# Altium schematic sheet Output_Stage.SchDoc
size 558 x 190 mm; SheetNumber: 2; SheetTotal: 3
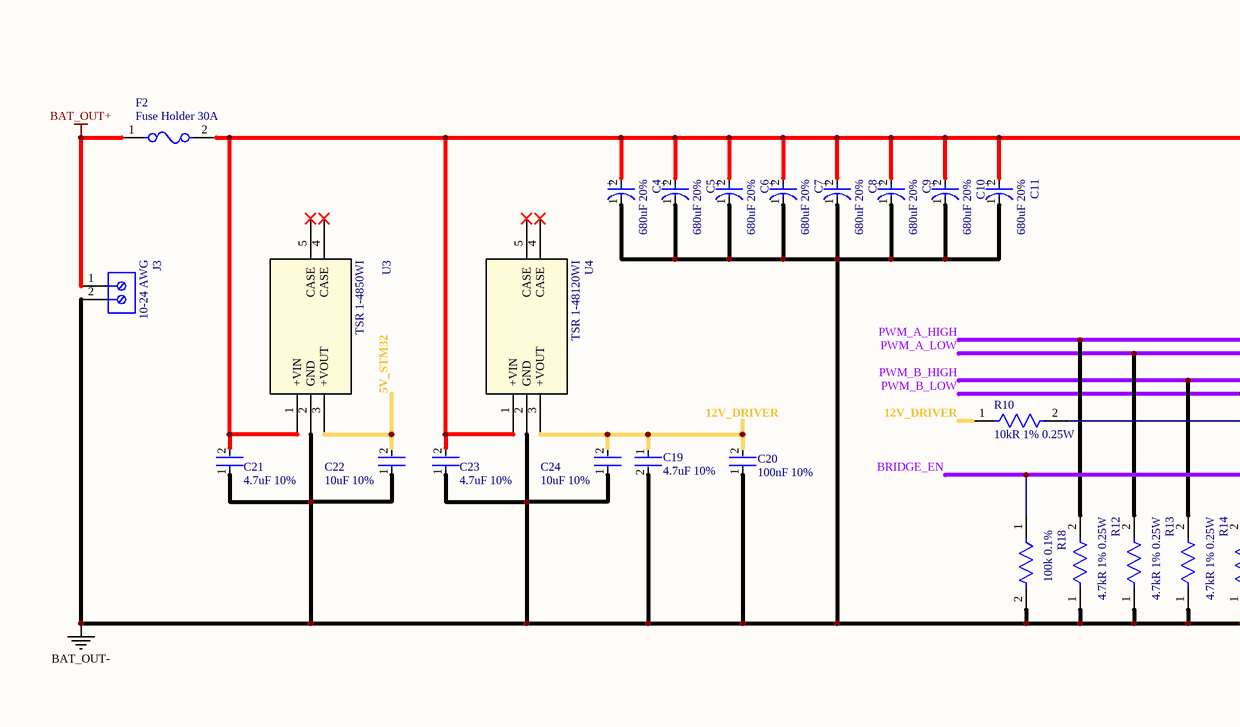
[diagram p0: Output_Stage.SchDoc, left]
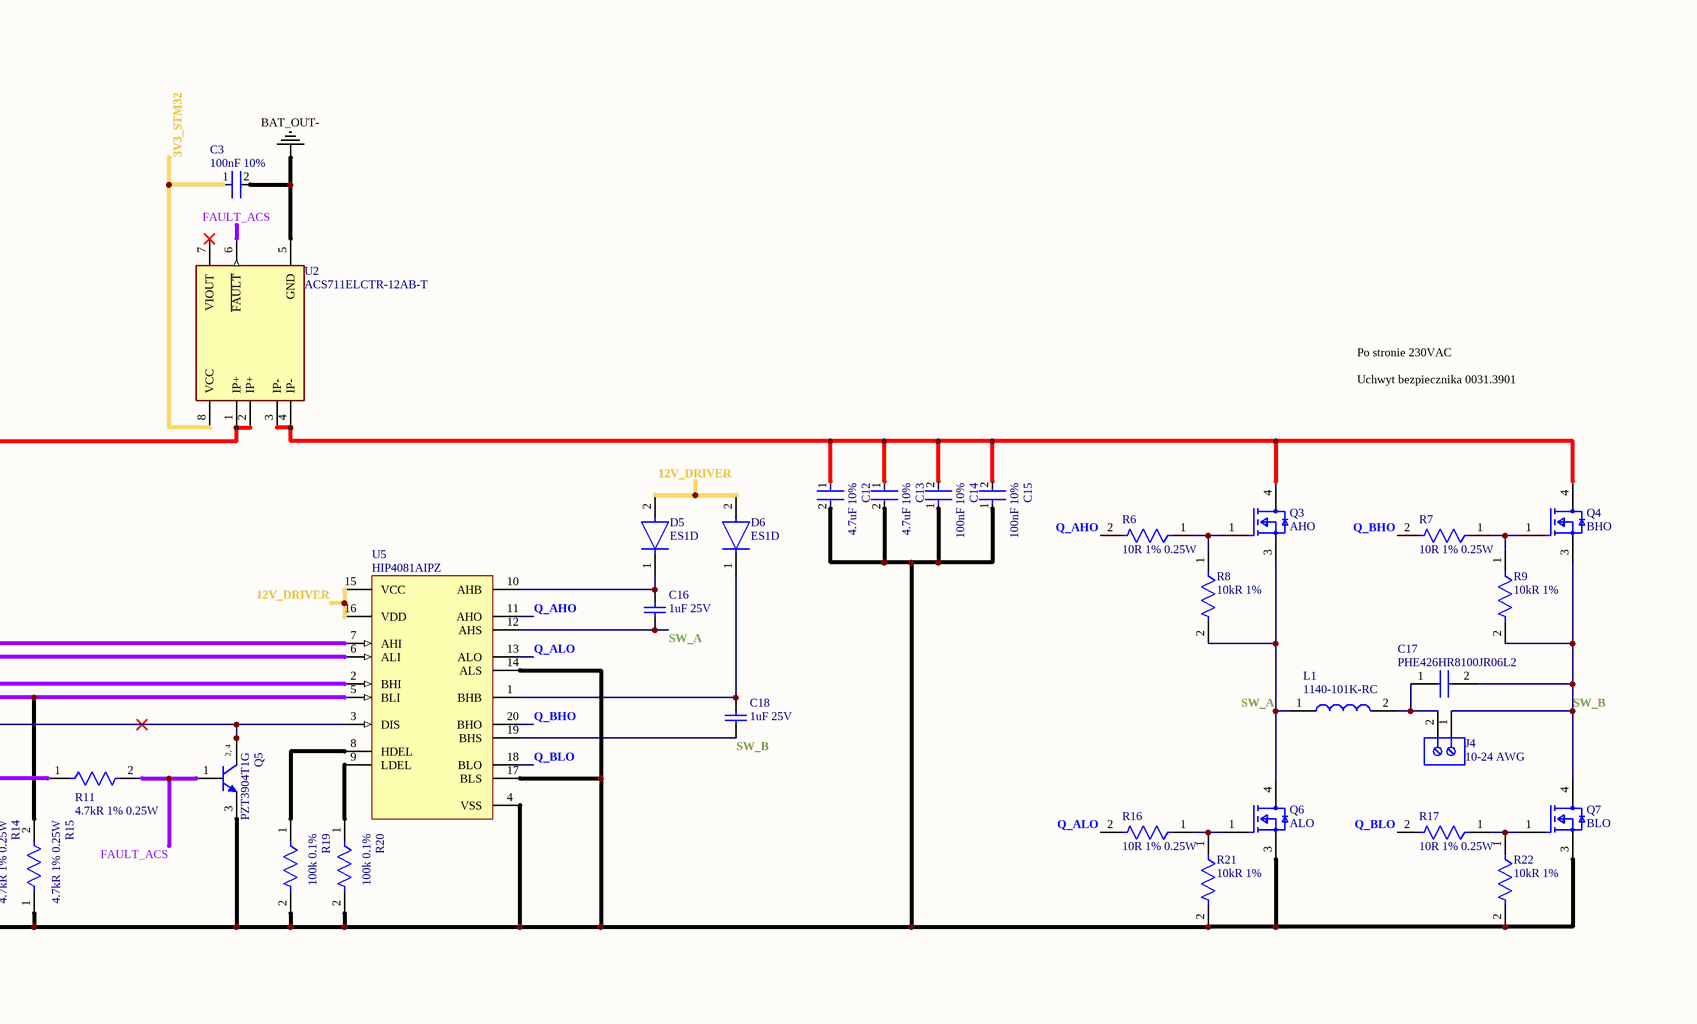
[diagram p1: Output_Stage.SchDoc, middle]
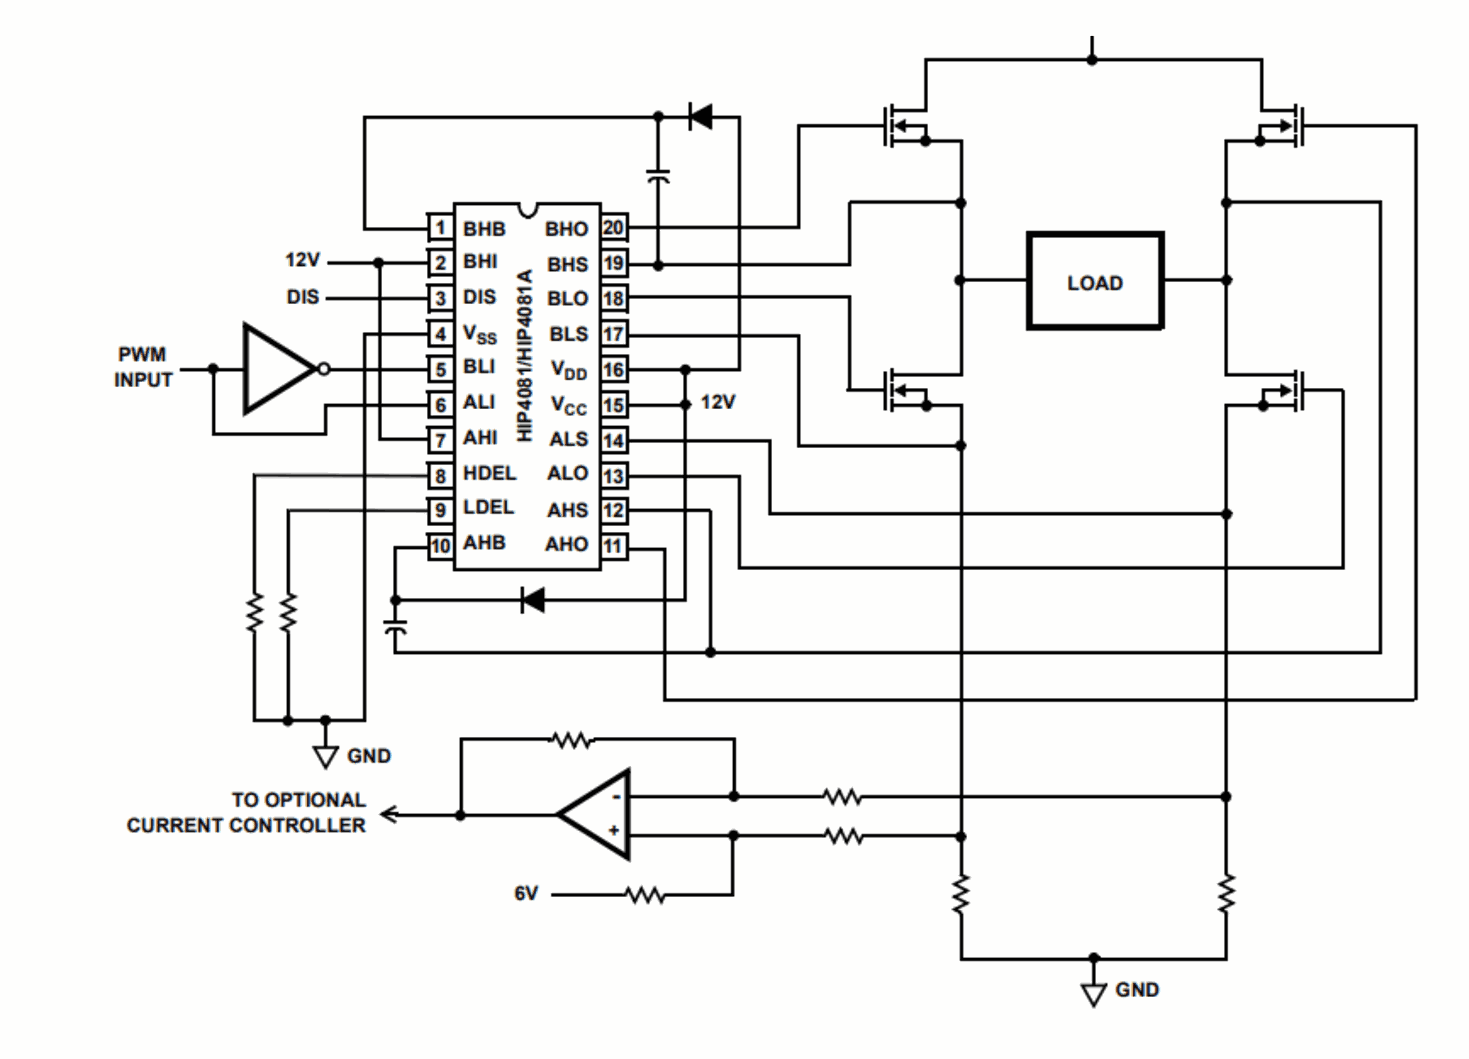
[diagram p2: Output_Stage.SchDoc, right]

## Parts
C3  100nF 10%  [FP-C0805C-DN-MFG]
C4  680uF 20%  [FP-RAD-TH-D_16_0_5-L_25_2-MFG]
C5  680uF 20%  [FP-RAD-TH-D_16_0_5-L_25_2-MFG]
C6  680uF 20%  [FP-RAD-TH-D_16_0_5-L_25_2-MFG]
C7  680uF 20%  [FP-RAD-TH-D_16_0_5-L_25_2-MFG]
C8  680uF 20%  [FP-RAD-TH-D_16_0_5-L_25_2-MFG]
C9  680uF 20%  [FP-RAD-TH-D_16_0_5-L_25_2-MFG]
C10  680uF 20%  [FP-RAD-TH-D_16_0_5-L_25_2-MFG]
C11  680uF 20%  [FP-RAD-TH-D_16_0_5-L_25_2-MFG]
C12  4.7uF 10%  [FP-CNA6P-MFG]
C13  4.7uF 10%  [FP-CNA6P-MFG]
C14  100nF 10%  [FP-C0805C-DN-MFG]
C15  100nF 10%  [FP-C0805C-DN-MFG]
C16  1uF 25V  [CAPC2013X140X50LL20T25]
C17  PHE426HR8100JR06L2  [PHE426HR8100JR06L2]
C18  1uF 25V  [CAPC2013X140X50LL20T25]
C19  4.7uF 10%  [FP-CNA6P-MFG]
C20  100nF 10%  [FP-C0805C-DN-MFG]
C21  4.7uF 10%  [FP-CNA6P-MFG]
C22  10uF 10%  [FP-C3225-250-0_4-MFG]
C23  4.7uF 10%  [FP-CNA6P-MFG]
C24  10uF 10%  [FP-C3225-250-0_4-MFG]
D5  ES1D  [FP-403AE-MFG]
D6  ES1D  [FP-403AE-MFG]
F2  Fuse Holder 30A  [FP-3568-MFG]
J3  10-24 AWG  [PHOE-1714955_V]
J4  10-24 AWG  [PHOE-1714955_V]
L1  1140-101K-RC  [1140101KRC]
Q3  AHO  [FP-PG-TO263-3-MFG]
Q4  BHO  [FP-PG-TO263-3-MFG]
Q5  PZT3904T1G  [ONSC-SOT-223-4-318E-04_V]
Q6  ALO  [FP-PG-TO263-3-MFG]
Q7  BLO  [FP-PG-TO263-3-MFG]
R6  10R 1% 0.25W  [FP-RT1206-MFG]
R7  10R 1% 0.25W  [FP-RT1206-MFG]
R8  10kR 1%  [FP-RT1206-MFG]
R9  10kR 1%  [FP-RT1206-MFG]
R10  10kR 1% 0.25W  [FP-RT1206-MFG]
R11  4.7kR 1% 0.25W  [FP-RT1206-MFG]
R12  4.7kR 1% 0.25W  [FP-RT1206-MFG]
R13  4.7kR 1% 0.25W  [FP-RT1206-MFG]
R14  4.7kR 1% 0.25W  [FP-RT1206-MFG]
R15  4.7kR 1% 0.25W  [FP-RT1206-MFG]
R16  10R 1% 0.25W  [FP-RT1206-MFG]
R17  10R 1% 0.25W  [FP-RT1206-MFG]
R18  100k 0.1%  [FP-RT1206-MFG]
R19  100k 0.1%  [FP-RT1206-MFG]
R20  100k 0.1%  [FP-RT1206-MFG]
R21  10kR 1%  [FP-RT1206-MFG]
R22  10kR 1%  [FP-RT1206-MFG]
U2  ACS711ELCTR-12AB-T  [FP-LC-8-IPC_C]
U3  TSR 1-4850WI  [TSR1WI-SINGLE_TRP]
U4  TSR 1-48120WI  [TSR1WI-SINGLE_TRP]
U5  HIP4081AIPZ  [DIP762W46P254L2590H533Q20_E20_3_N]

## Nets
BAT_OUT+: F2.1 J3.1
BAT_OUT-: C3.2 C4.1(C) C5.1(C) C6.1(C) C7.1(C) C8.1(C) C9.1(C) C10.1(C) C11.1(C) C12.2 C13.2 C14.1 C15.1 C19.2 C20.1 C21.1 C22.1 C23.1 C24.1 J3.2 Q5.3(E) Q6.3(S) Q7.3(S) R12.1 R13.1 R14.1 R15.1 R18.2 R19.2 R20.2 R21.2 R22.2 U2.5(GND) U3.2(GND) U4.2(GND) U5.4(VSS) U5.14(ALS) U5.17(BLS)
3V3_STM32: C3.1 U2.8(VCC)
5V_STM32: C22.2 U3.3(+VOUT)
12V_DRIVER: C19.1 C20.2 C24.2 D5.2(A) D6.2(A) R10.1 U4.3(+VOUT) U5.15(VCC) U5.16(VDD)
BRIDGE_EN: R11.1 R18.1
FAULT_ACS: Q5.1(B) R11.2 U2.6(~{FAULT})
PWM_A_HIGH: R12.2 U5.7(AHI)
PWM_A_LOW: R13.2 U5.6(ALI)
PWM_B_HIGH: R14.2 U5.2(BHI)
PWM_B_LOW: R15.2 U5.5(BLI)
Q_AHO: R6.2 U5.11(AHO)
Q_ALO: R16.2 U5.13(ALO)
Q_BHO: R7.2 U5.20(BHO)
Q_BLO: R17.2 U5.18(BLO)
SW_A: C16.2 L1.1 Q3.3(S) Q6.4(D) R8.2 U5.12(AHS)
SW_B: C17.2 C18.2 J4.1 Q4.3(S) Q7.4(D) R9.2 U5.19(BHS)
NetC4_2: C4.2(A) C5.2(A) C6.2(A) C7.2(A) C8.2(A) C9.2(A) C10.2(A) C11.2(A) C21.2 C23.2 F2.2 U2.1(IP+) U2.2(IP+) U3.1(+VIN) U4.1(+VIN)
NetC12_1: C12.1 C13.1 C14.2 C15.2 Q3.4(D) Q4.4(D) U2.3(IP-) U2.4(IP-)
NetC16_1: C16.1 D5.1(C) U5.10(AHB)
NetC17_1: C17.1 J4.2 L1.2
NetC18_1: C18.1 D6.1(C) U5.1(BHB)
NetQ3_1: Q3.1(G) R6.1 R8.1
NetQ4_1: Q4.1(G) R7.1 R9.1
NetQ5_2: Q5.2(C) Q5.4(C) R10.2 U5.3(DIS)
NetQ6_1: Q6.1(G) R16.1 R21.1
NetQ7_1: Q7.1(G) R17.1 R22.1
NetR19_1: R19.1 U5.8(HDEL)
NetR20_1: R20.1 U5.9(LDEL)

Not connected (* = marked no-connect by the designer): U2 7(VIOUT)*; U3 4(CASE)* 5(CASE)*; U4 4(CASE)* 5(CASE)*

## Notes on the sheet
- Po stronie 230VAC
  Uchwyt bezpiecznika 0031.3901
  Oraz wkładka bezpiecznikowa 0001.2501
- (in symbol CMP-1048-00481-1) 2, 4
- (in symbol CMP-05427-001257-1) +

## Library data of the parts
C3 C14 C15 C20 = CMP-2007-00279-2: C0805C104K5RACTU / CAP CER 0.1UF 50V X7R 0805; Manufacturer: KEMET; Value: 0.10 μF; Tolerance: 0.1; Temperature Coefficient: 30ppm/°C; Material: Ceramic; Manufacturer Part Number: C0805C104K5RACTU; Device Class L2: Capacitors; Temperature Range Low: -55°C; Voltage Rating: 50 V; Digikey Description: CAP CER 0.1UF 50V X7R 0805; Category: Cap; ComponentLink2Description: Datasheet; Octopart: https://octopart.com/c0805c104k5ractu-kemet-143926; RoHS: TRUE; ComponentLink2URL: https://content.kemet.com/datasheets/KEM_C1003_C0G_SMD.pdf; Temperature Characteristic: X7R; Temperature: -55°C to +125°C; Height: 0.88mm; Temperature Range High: +125°C; Device Class L1: Passive Components; Automotive: No; Lead Free: Yes; Ipc Land Pattern Name: CAPC200125X78; Device Class L3: Ceramic Capacitors; Mouser Description: Cap Ceramic 0.1uF 50V X7R 10% SMD 2.0 x 1.2 mm 125 C Paper T/R; Capacitance: 0.10 μF; Package: C0805C-DN
C4-C11 = CMP-05427-001257-1: EEUFS1K681B / Aluminum Electrolytic Capacitors (Radial Lead Type) 680uF ±20% 80V; RoHS Compliant: Yes
C12 C13 C19 C21 C23 = CMP-08246-000008-1: CNA6P1X7R2A475K250AE / CAP CER 4.7UF 100V X7R 1210; Manufacturer: TDK; Automotive Grade: Grade 1; Material: Ceramic; Temperature Coefficient: 15%; Temperature: -55°C to +125°C; Lead Free: Yes; RoHS: TRUE; Digikey Description: CAP CER 4.7UF 100V X7R 1210; Category: Cap; Device Class L1: Passive Components; Tolerance: 10%; ComponentLink2URL: https://product.tdk.com/info/en/catalog/datasheets/mlcc_automotive_soft_cna_en.pdf; Octopart: https://octopart.com/cna6p1x7r2a475k250ae-tdk-96979044; Device Class L3: Ceramic Capacitors; Height: 2.8mm; Voltage Rating: 100V; Value: 4.7uF; Temperature Range High: +125°C; Ipc Land Pattern Name: CAPC320250X250; Capacitance: 4.7uF; Temperature Characteristic: X7R; Package: CNA6P; Automotive: Yes; Manufacturer Part Number: CNA6P1X7R2A475K250AE; Temperature Range Low: -55°C; Device Class L2: Capacitors; ComponentLink2Description: Datasheet; Footprint Url: https://product.tdk.com/info/en/catalog/spec/mlccspec_automotive_soft_cna_en.pdf
C16 C18 = CMP-2007-03234-1: C0805C105K3RACTU; Manufacturer: Kemet; Part Number: C0805C105K3RACTU
C17 = PHE426HR8100JR06L2: Capacitor; Manufacturer_Name: Yageo Group; Datasheet Link: https://search.kemet.com/component-documentation/download/specsheet/F426RK106J250C; Height: 32mm; Manufacturer_Part_Number: PHE426HR8100JR06L2; Mouser Part Number: 80-PHE426HR8100JR6L2; Mouser Price/Stock: https://www.mouser.co.uk/ProductDetail/KEMET/PHE426HR8100JR06L2?qs=LpuuGx8iR2QFB19k2AHYGw%3D%3D
C22 C24 = CMP-08246-003742-1: C3225X7R1N106K250AC / Multilayer Ceramic Capacitors 10uF ±10% 75V X7R SMD 1210; RoHS Compliant: Yes
D5 D6 = CMP-2000-06230-3: DIODE GEN PURP 200V 1A SMA; Manufacturer: ON Semi; Peak Reverse Current: 5uA; Value: 7pF; Max Surge Forward Current: 30A; Max Junction Temp: +150°C; Standoff Height: 0.05mm; Temperature Range High: +150°C; Footprint Url: http://www.onsemi.com/pub/Collateral/403AE.PDF; Category: Diode; Device Class L3: Rectifier Diodes; RoHS: TRUE; Package: 403AE; Temperature Range Low: -50°C; Lead Free: Yes; Device Class L1: Discrete Semiconductors; ComponentLink2Description: Datasheet; Device Class L2: Diodes; Capacitance: 7pF; Temperature: -50°C to +150°C; Manufacturer Part Number: ES1D; Automotive: No; Max Repetitive Reverse Voltage: 200V; Octopart: https://octopart.com/es1d-on+semiconductor-84324855; ComponentLink2URL: https://www.onsemi.jp/PowerSolutions/document/ES1D-D.PDF; Height: 2.5mm; Forward Current: 1A; Digikey Description: DIODE GEN PURP 200V 1A SMA
F2 = CMP-2000-05464-2: 3568; NexarPartId: 8116161; Approvals: UL; Body Material: Nylon; Illumination Type: Illuminated; Voltage Rating (AC): 500V; Current Rating: 20A; Number of Poles: 1; Color: Black; Material: Brass, Nylon, Tin; Depth: 6.73mm; Max Operating Temperature: 145°C; Length: 16mm; Mount: PCB, Vertical; REACH SVHC: No SVHC; Lead Free: Lead Free; Min Operating Temperature: -50°C; Flammability Rating: UL94 V-0; RoHS: Compliant; Orientation: Vertical; Fuse Current: 20A; Termination: PC Pin; Number of Circuits: 1; Contact Plating: Tin; Voltage: 500V; Contact Material: Brass
J3 J4 = CMP-2000-05797-1: 1714955 / PC Terminal Block, Pitch 6.35 mm, 1 x 2 Position, Height 21.5 mm, Tail Lenght 5.1 mm, RoHS, Bulk; Manufacturer: Phoenix Contact; Package Description: PC Terminal Block, Pitch 6.35 mm, 1 x 2 Position, Height 21.5 mm, Tail Lenght 5.1 mm; Datasheet URL: http://media.digikey.com/pdf/Data%20Sheets/Phoenix%20Contact%20PDFs/1714955.pdf; Package Reference: 1714955; Manufacturer URL: http://www.phoenixcontact.com/; Datasheet Version: 02/2010; Mounting Technology: ThroughHole
L1 = 1140-101K-RC: Inductor; Manufacturer_Name: Bourns; Datasheet Link: http://www.bourns.com/docs/Product-Datasheets/1140_series.pdf; Height: 26.162mm; Manufacturer_Part_Number: 1140-101K-RC; Mouser Part Number: 542-1140-101K-RC; Mouser Price/Stock: https://www.mouser.co.uk/ProductDetail/Bourns/1140-101K-RC?qs=OvPYepjWVtSJktibIwUvvA%3D%3D; Arrow Part Number: 1140-101K-RC; Arrow Price/Stock: https://www.arrow.com/en/products/1140-101k-rc/bourns?region=europe
Q3 Q4 Q6 Q7 = CMP-32901-001127-1: IPB031N08N5ATMA1 / MOSFET N-CH 80V 120A D2PAK; Element Configuration: Single; Gate to Source Voltage (Vgs): 20V; Rise Time: 18ns; Rds On Max: 3.1mR; Drain to Source Resistance: 4.1mR; Number of Channels: 1; Fall Time: 12ns; Max Power Dissipation: 167W; Turn-Off Delay Time: 37ns; Polarity: N-CHANNEL; Input Capacitance: 6.24nF; Max Operating Temperature: 175°C; Packaging: Tape and Reel; Package Quantity: 1000; Lead Free: Contains Lead; Min Operating Temperature: -55°C; Drain to Source Voltage (Vdss): 80V; Mount: Surface Mount; Max Dual Supply Voltage: 80V; RoHS Compliant: Yes; Weight: 0.139332oz; Turn-On Delay Time: 18ns; Halogen Free: Halogen Free; Drain to Source Breakdown Voltage: 80V; Series: OptiMOS™; Case/Package: TO-263-3; Continuous Drain Current (ID): 120A; Number of Pins: 3
Q5 = CMP-1048-00481-1: General Purpose Transistor, NPN Silicon, 4-Pin SOT-223, Pb-Free, Tape and Reel; Manufacturer: On Semiconductor; IC Continuous (A): 0.2; fT Min (MHz): 300; PackageVersion: Rev. N, 08/2009; Mounting Technology: Surface Mount; PartNumber: PZT3904T1G; ComponentLink2Description: Datasheet; ComponentLink1Description: Manufacturer URL; Polarity: NPN; Packing: Tape and Reel; RoHS: TRUE; PackageReference: SOT-223-4-318E-04; PackageDescription: 4-Pin Small Outline Transistor, Body 6.5 x 3.5 mm, Pitch 2.3 mm; ComponentLink3Description: Package Specification; ComponentLink1URL: http://www.onsemi.com/; ComponentLink2URL: http://www.onsemi.com/pub_link/Collateral/PZT3904T1-D.PDF; DatasheetVersion: Rev. 6; ComponentLink3URL: http://www.onsemi.com/pub_link/Collateral/318E-04.PDF
R6 R7 R16 R17 = CMP-2003-04091-2: RT1206FRE0710RL / RES SMD 10 OHM 1% 1/4W 1206; Manufacturer: Yageo; Temperature Coefficient: 50 ppm/°C; Value: 10Ω; Voltage Rating: 200V; Tolerance: 0.0002; Temperature Range Low: -55°C; Digikey Description: RES SMD 10 OHM 1% 1/4W 1206; Power Rating: 0.25W; Footprint Url: http://www.yageo.com/exep/pages/download/literatures/PYu-R_Mount_10.pdf; Octopart: https://octopart.com/rt1206fre0710rl-yageo-1385105; Lead Free: Yes; Temperature: -55°C to +155°C; Package: RT1206; Ipc Land Pattern Name: RESC310160X55; Device Class L2: Resistors; Composition: Thin Film; Category: Res; Series: RT; Automotive: No; RoHS: TRUE; Temperature Range High: +155°C; Manufacturer Part Number: RT1206FRE0710RL; Device Class L1: Passive Components; Height: 0.65mm; Device Class L3: Chip SMD Resistors; ComponentLink2Description: Datasheet; Mouser Description: High Precision-High Stability Chip Resistor Thin Film 1206 10Ohm 1% Paper T/R; ComponentLink2URL: http://www.yageo.com/documents/recent/PYu-RT_1-to-0.01_RoHS_L_9.pdf; Resistance: 10Ω
R8 R9 R21 R22 = CMP-2003-04299-2: RT1206FRE0710KL / RES 10.0K OHM 1/4W 1% SMD 1206; Manufacturer: Yageo; Power Rating: 0.25W; Voltage Rating: 200V; Temperature Coefficient: 50 ppm/°C; Tolerance: 0.0002; Value: 10KΩ; Height: 0.65mm; Composition: Thin Film; Temperature Range Low: -55°C; Temperature Range High: +155°C; Device Class L2: Resistors; RoHS: TRUE; Digikey Description: RES 10.0K OHM 1/4W 1% SMD 1206; Manufacturer Part Number: RT1206FRE0710KL; Device Class L1: Passive Components; ComponentLink2URL: http://www.yageo.com/documents/recent/PYu-RT_1-to-0.01_RoHS_L_9.pdf; Category: Res; Lead Free: Yes; Mouser Description: Thin Film Resistors 1/4W 10K ohm 1% 50ppm; Octopart: https://octopart.com/rt1206fre0710kl-yageo-1169575; ComponentLink2Description: Datasheet; Footprint Url: http://www.yageo.com/exep/pages/download/literatures/PYu-R_Mount_10.pdf; Ipc Land Pattern Name: RESC310160X55; Package: RT1206; Automotive: No; Device Class L3: Chip SMD Resistors; Temperature: -55°C to +155°C; Series: RT; Resistance: 10KΩ
R10 = CMP-2003-04299-2: RT1206FRE0710KL / RES 10.0K OHM 1/4W 1% SMD 1206; Manufacturer: Yageo; Voltage Rating: 200V; Temperature Coefficient: 50 ppm/°C; Tolerance: 0.0002; Value: 10KΩ; Height: 0.65mm; Composition: Thin Film; Temperature Range Low: -55°C; Temperature Range High: +155°C; Device Class L2: Resistors; Power Rating: 0.25W; RoHS: TRUE; Digikey Description: RES 10.0K OHM 1/4W 1% SMD 1206; Manufacturer Part Number: RT1206FRE0710KL; Device Class L1: Passive Components; ComponentLink2URL: http://www.yageo.com/documents/recent/PYu-RT_1-to-0.01_RoHS_L_9.pdf; Category: Res; Lead Free: Yes; Mouser Description: Thin Film Resistors 1/4W 10K ohm 1% 50ppm; Octopart: https://octopart.com/rt1206fre0710kl-yageo-1169575; ComponentLink2Description: Datasheet; Footprint Url: http://www.yageo.com/exep/pages/download/literatures/PYu-R_Mount_10.pdf; Ipc Land Pattern Name: RESC310160X55; Package: RT1206; Automotive: No; Device Class L3: Chip SMD Resistors; Temperature: -55°C to +155°C; Series: RT; Resistance: 10KΩ
R11-R15 = CMP-2003-04318-2: RT1206FRE074K7L / RES SMD 4.7K OHM 1% 1/4W 1206; Manufacturer: Yageo; Temperature Coefficient: 50 ppm/°C; Value: 4.7KΩ; Voltage Rating: 200V; Tolerance: 0.0002; Temperature Range Low: -55°C; Lead Free: Yes; Height: 0.65mm; Device Class L1: Passive Components; Temperature Range High: +155°C; Composition: Thin Film; Manufacturer Part Number: RT1206FRE074K7L; Device Class L2: Resistors; RoHS: TRUE; Automotive: No; Ipc Land Pattern Name: RESC310160X55; Series: RT; Temperature: -55°C to +155°C; Device Class L3: Chip SMD Resistors; Category: Res; Resistance: 4.7KΩ; Digikey Description: RES SMD 4.7K OHM 1% 1/4W 1206; Power Rating: 0.25W; ComponentLink2Description: Datasheet; Package: RT1206; Footprint Url: http://www.yageo.com/exep/pages/download/literatures/PYu-R_Mount_10.pdf; ComponentLink2URL: http://www.yageo.com/documents/recent/PYu-RT_1-to-0.01_RoHS_L_9.pdf; Mouser Description: Res Thin Film 1206 4.7K Ohm 1% 0.25W(1/4W) ?50ppm/C Molded SMD Paper T/R; Octopart: https://octopart.com/rt1206fre074k7l-yageo-1218966
R18-R20 = CMP-2003-04272-2: RT1206BRD07100KL / RES 100K OHM 1/4W .1% SMD 1206; Manufacturer: Yageo; Voltage Rating: 200V; Power Rating: 0.25W; Tolerance: 0.005; Temperature Coefficient: 25 ppm/°C; Value: 100KΩ; Ipc Land Pattern Name: RESC310160X55; Octopart: https://octopart.com/rt1206brd07100kl-yageo-1375718; ComponentLink2URL: http://www.yageo.com/documents/recent/PYu-RT_1-to-0.01_RoHS_L_9.pdf; ComponentLink2Description: Datasheet; Series: RT; Digikey Description: RES 100K OHM 1/4W .1% SMD 1206; Automotive: No; Device Class L1: Passive Components; Temperature Range High: +155°C; Temperature: -55°C to +155°C; Composition: Thin Film; Temperature Range Low: -55°C; Device Class L3: Chip SMD Resistors; Height: 0.65mm; Manufacturer Part Number: RT1206BRD07100KL; Mouser Description: Res Thin Film 1206 100K Ohm 0.1% 0.25W(1/4W) ±25ppm/C Epoxy Pad SMD T/R; Package: RT1206; Category: Res; Footprint Url: http://www.yageo.com/exep/pages/download/literatures/PYu-R_Mount_10.pdf; Resistance: 100KΩ; Device Class L2: Resistors; Lead Free: Yes; RoHS: TRUE
U2 = CMP-1557-00014-2: SENSOR CURRENT HALL 12.5A AC/DC; Response Time: 4.6us; Operating Supply Voltage: 3.3V; Frequency: 100kHz; Max Supply Current: 5.5mA; Sensitivity: 110mV/A; Number of Channels: 1; Accuracy: 5%; Polarity: Bidirectional; Linearity: 1%; Max Operating Temperature: 85°C; Min Operating Temperature: -40°C; Case/Package: SOIC; Package Quantity: 1; Series: -; -3db Bandwidth: 100kHz; Current Sensing: 12.5A; Packaging: Tape and Reel; RoHS Compliant: Yes; Number of Pins: 8
U3 = CMP-01539-104759533-1: TSR 1-4850WI DC-DC Converter, POL, Industrial, Encapsulated, 1A, 5V Out, 9-72V In; Output Power: 5W; NexarPartId: 104759533
U4 = CMP-01539-104759529-1: TSR 1-48120WI DC-DC Converter, POL, Industrial, Encapsulated, 1A, 12V Out, 17-72V In; Output Power: 12W; NexarPartId: 104759529
U5 = CMP-00572-88252434-2: Driver 2.5A 4-OUT Hi/Lo Side Full Brdg/Half Brdg Inv/Non-Inv Automotive 20-Pin PDIP Tube; Manufacturer Lifecycle Status: ACTIVE; Nominal Supply Current: 10.5mA; Max Supply Voltage: 15V; Pitch: 2.5mm; Number of Channels: 4; RAM Size: 32kB; Max Power Dissipation: 440mW; Turn-On Delay Time: 110ns; Fall Time: 10ns; Number of Drivers: 1; Output Voltage: 12.6V; Propagation Delay: 30ns; Overload Protection: Under Voltage; Min Supply Voltage: 9.5V; Turn-Off Delay Time: 90ns; Max Supply Current: 15.5mA; Switching Frequency: 1MHz; Number of Pins: 20; ComponentLink2Description: Datasheet URL; ComponentLink1Description: Manufacturer's Website; Max Output Current: 2.5A; Max Output Voltage: 15V; REACH SVHC: No; Packaging: Bulk; Min Operating Temperature: -40°C; Height: 3.94mm; ComponentLink2URL: https://octopart.com/cad-content/api/get-model-datasheet/15189/88252434; ComponentLink3Description: Manufacturer's Package Drawing; Lead Free: Lead Free; Export Control Classification Number (ECCN) Code: EAR99; HelpURL: https://octopart.com/cad-content/api/get-model-datasheet/15189/88252434; Max Operating Temperature: 85°C; Rise Time: 10ns; ComponentLink1URL: http://www.renesas.com; Width: 6.6mm; Number of Outputs: 4; ComponentLink3URL: https://www.renesas.com/en/document/psc/e203-20-lead-dual-line-plastic-packages; Lifecycle Status: Production; Length: 26.2mm; Output Current: 2.5A; Mount: Through Hole; Case/Package: PDIP; RoHS: Compliant